# EasyEDA Pro project realtix-sakura_nfc-d968f2f9.epro, schematic Schematic2
Board Name: 鸟头杖; Create Date: 2025-03-24; Page Name: P1; Project Name: 小樱nfc鸟头杖; Schematic Name: Schematic2; Update Date: 2025-03-24; Company: 嘉立创EDA; Page Size: A3; Version: V1.0
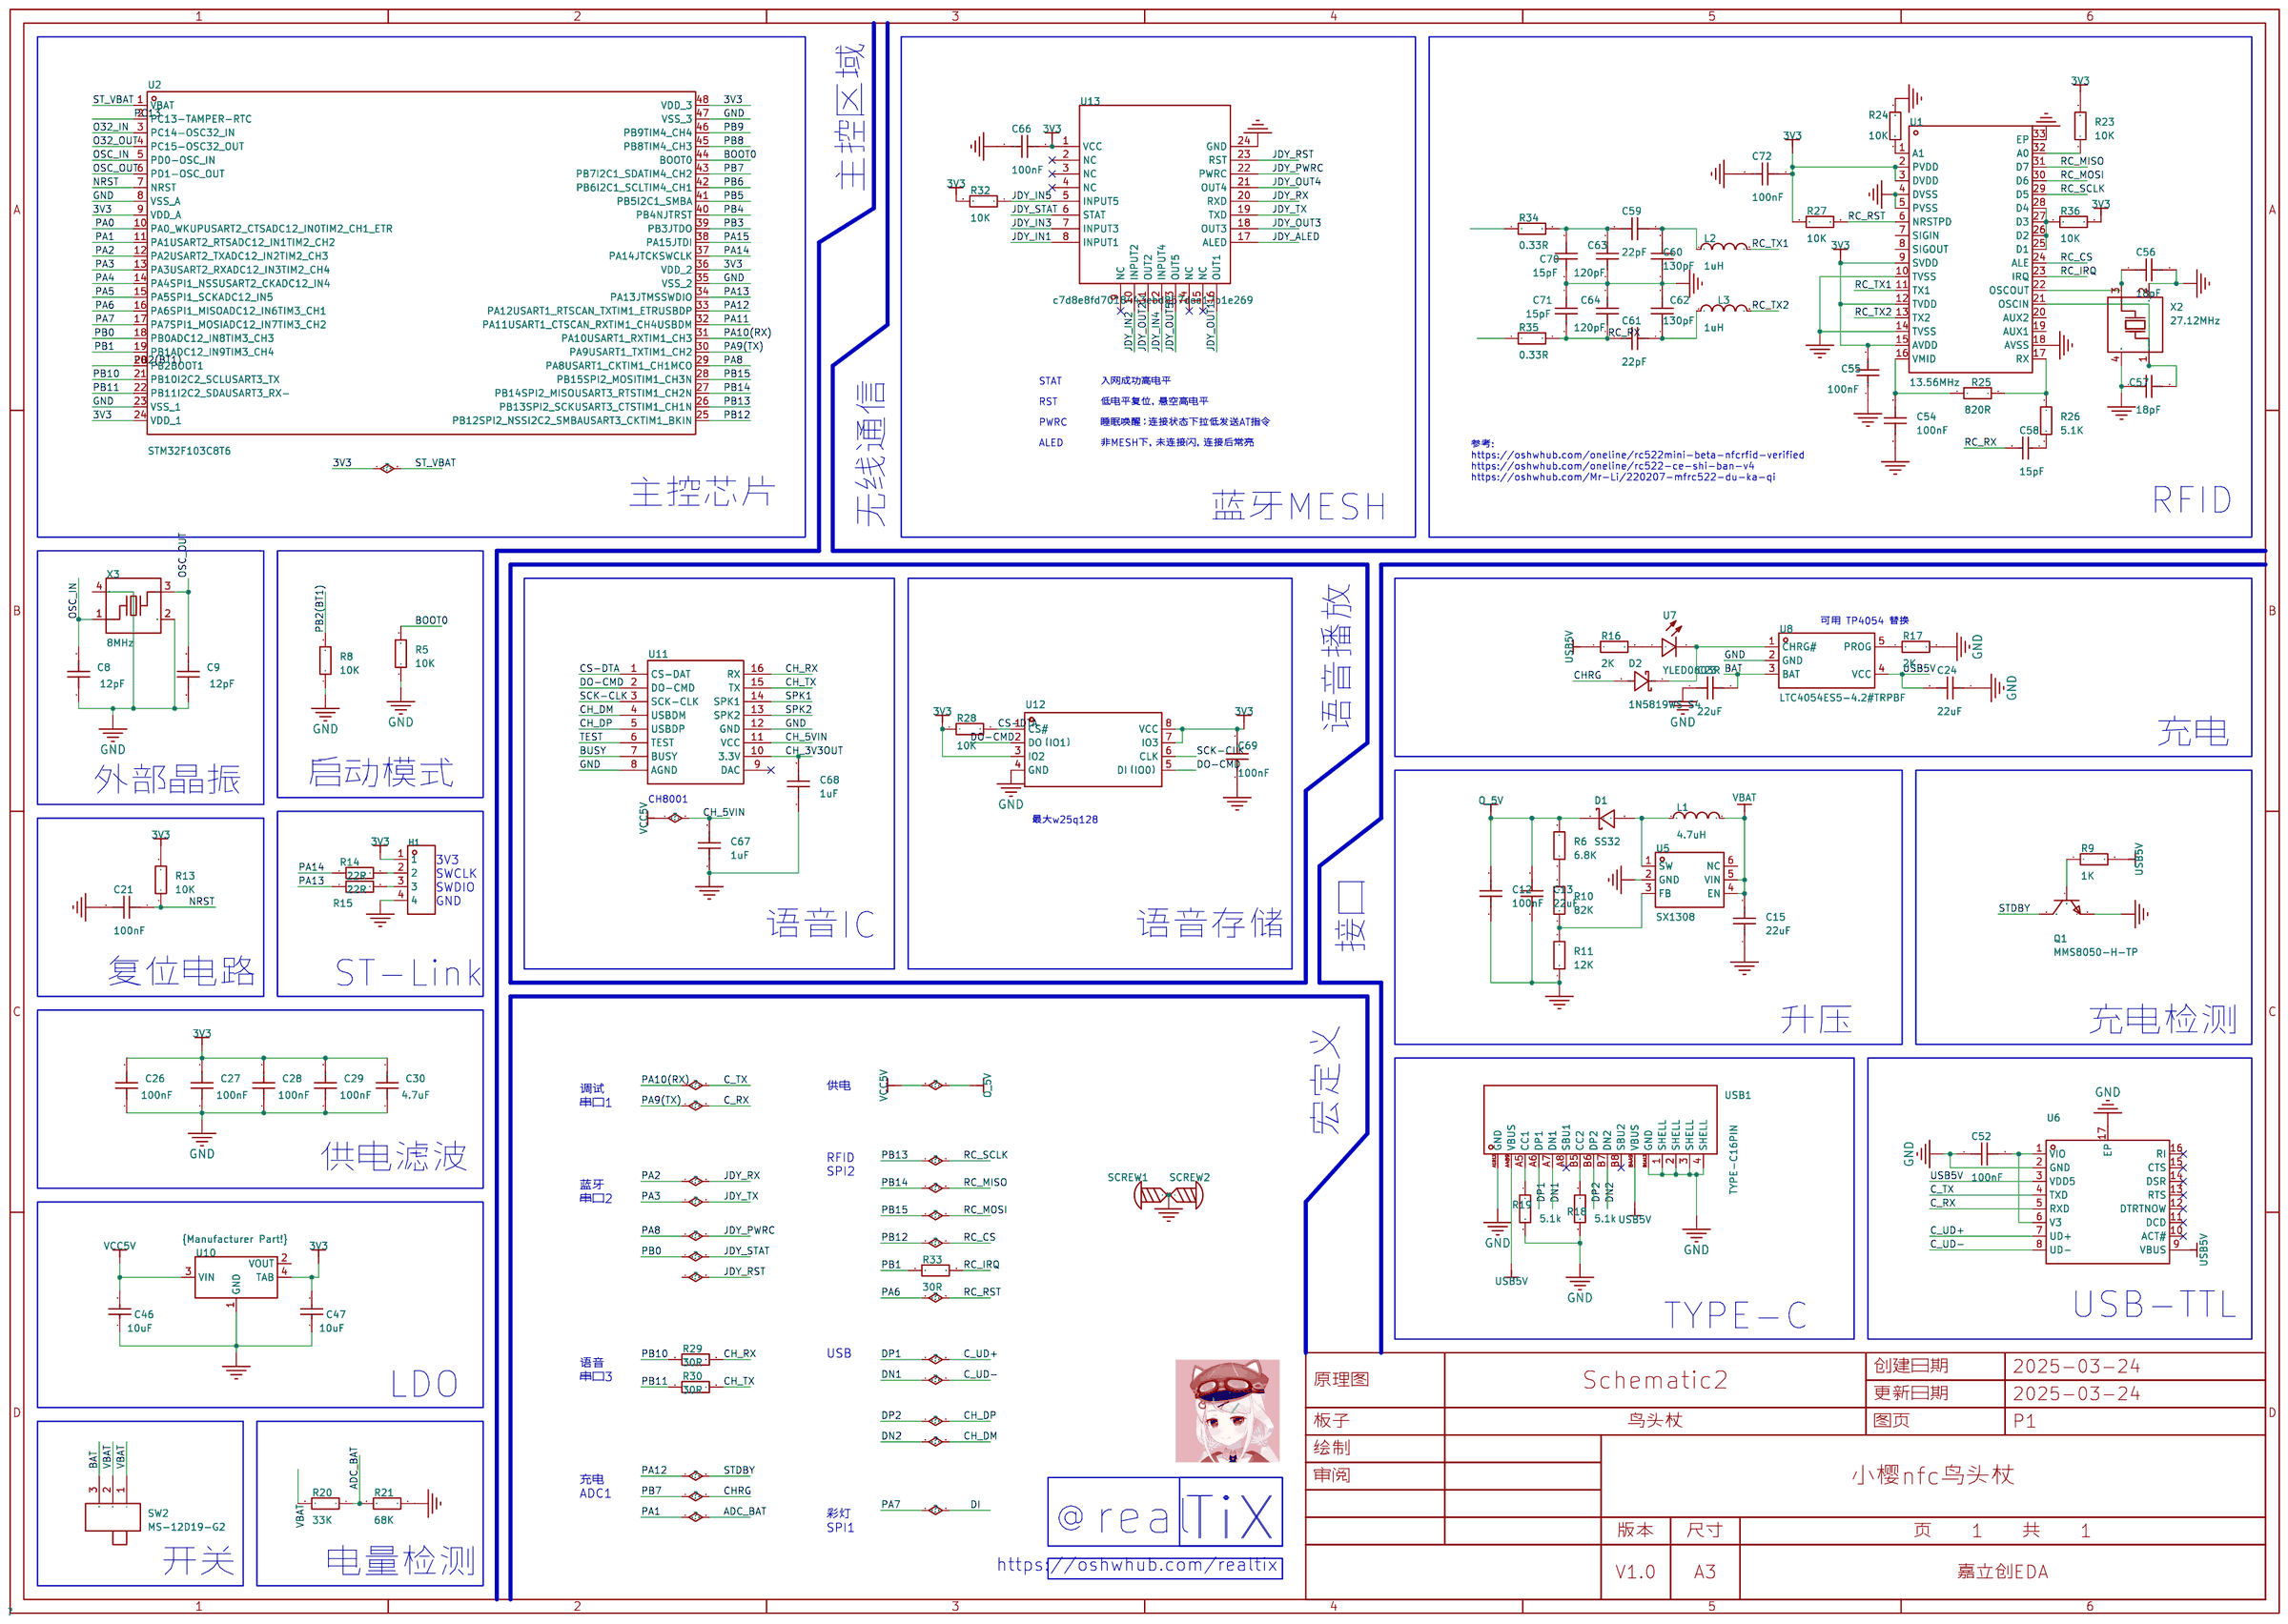
[diagram p1: schematic sheet]

## Parts
C8  12pF  [C0603]
C9  12pF  [C0603]
C12  100nF  [C0603]
C13  22uF  [C0805]
C15  22uF  [C0805]
C21  100nF  [C0603]
C23  22uF  [C0805]
C24  22uF  [C0805]
C26  100nF  [C0603]
C27  100nF  [C0603]
C28  100nF  [C0603]
C29  100nF  [C0603]
C30  4.7uF  [C0805]
C46  10uF  [C0805]
C47  10uF  [C0805]
C52  100nF  [C0603]
C54  100nF  [C0603]
C55  100nF  [C0603]
C56  18pF  [C0603]
C57  18pF  [C0603]
C58  15pF  [C0603]
C59  22pF  [C0603]
C60  130pF  [C0603]
C61  22pF  [C0603]
C62  130pF  [C0603]
C63  120pF  [C0603]
C64  120pF  [C0603]
C66  100nF  [C0603]
C67  1uF  [C0603]
C68  1uF  [C0603]
C69  100nF  [C0603]
C70  15pF  [C0603]
C71  15pF  [C0603]
C72  100nF  [C0603]
D1  SS32  [SMA_L4.4-W2.8-LS5.4-RD]
D2  1N5819WS S4  [SOD-323_L1.6-W1.3-LS2.7-RD]
H1  PZ254V-11-04P  [HDR-TH_4P-P2.54-V-M]
L1  4.7uH  [IND-SMD_L4.4-W4.2]
L2  1uH  [L0805]
L3  1uH  [L0805]
Q1  MMS8050-H-TP  [SOT-23-3_L2.9-W1.3-P1.90-LS2.4-BR]
R5  10K  [R0603]
R6  6.8K  [R0603]
R8  10K  [R0603]
R9  1K  [R0603]
R10  82K  [R0603]
R11  12K  [R0603]
R13  10K  [R0603]
R14  22R  [R0603]
R15  22R  [R0603]
R16  2K  [R0603]
R17  2K  [R0603]
R18  5.1k  [R0603]
R19  5.1k  [R0603]
R20  33K  [R0603]
R21  68K  [R0603]
R23  10K  [R0603]
R24  10K  [R0603]
R25  820R  [R0603]
R26  5.1K  [R0603]
R27  10K  [R0603]
R28  10K  [R0603]
R29  30R  [R0603]
R30  30R  [R0603]
R32  10K  [R0603]
R33  30R  [R0603]
R34  0.33R  [R0603]
R35  0.33R  [R0603]
R36  10K  [R0603]
SCREW1  -  [M2螺丝]
SCREW2  -  [M2螺丝]
SW2  MS-12D19-G2  [SW-TH_DEALON_MS-12D19-G2]
U1  13.56MHz  [QFN-32_L5.0-W5.0-P0.50-TL-EP3.1]
U2  STM32F103C8T6  [LQFP-48_L7.0-W7.0-P0.50-LS9.0-BL]
U5  SX1308  [SOT-23-6_L2.9-W1.6-P0.95-LS2.8-BL]
U6  CH343P  [TQFN-16_L3.0-W3.0-P0.50-BL-EP1.7]
U7  YLED0603R  [LED0603-FD]
U8  LTC4054ES5-4.2#TRPBF  [TSOT-23-5_L2.9-W1.6-P0.95-LS2.8-BL]
U10  -  [SOT_223]
U11  -  [SOP-16_L9.9-W3.9-P1.27-LS6.0-BL]
U12  W25Q32JVSSIQ  [SOIC-8_L5.3-W5.3-P1.27-LS8.0-BL]
U13  c7d8e8fd7018443ebd857dee17b1e269  [JDY-25M]
USB1  TYPE-C16PIN  [USB-C-SMD_TYPE-C16PIN]
X2  27.12MHz  [CRYSTAL-SMD_4P-L3.2-W2.5-BL-1]
X3  8MHz  [CRYSTAL-SMD_4P-L3.2-W2.5-BL]

## Library data of the parts
C8 C9 C12 C21 C26-C30 C52 C54-C57 C66-C69 C72 = CAP_0603: Supplier Footprint: 0603
C13 C15 = CL21A226MAQNNNE_C45783: 容值:22uF;精度:±20%;额定电压:25V;材质(温度系数):X5R;; LCSC Part Name: 22uF ±20% 25V; Supplier Part: C45783; Manufacturer: SAMSUNG(三星); Manufacturer Part: CL21A226MAQNNNE; Supplier Footprint: 0805; JLCPCB Part Class: Basic Part; Datasheet: https://atta.szlcsc.com/upload/public/pdf/source/20160103/1457707727161.pdf; Supplier: LCSC; Tolerance: ±20%; Voltage Rated: 25V; Temperature Coefficient: X5R
C23 C24 = C2012X5R1V226MT000E: 温度系数:X5R;额定电压:35V;电容体长:-;电容体宽:-;电容体厚度:-;精度:±20%;容值:22uF;; LCSC Part Name: 22uF(226) ±20% 35V; Supplier Part: C338080; Manufacturer: TDK; Supplier Footprint: 0805; JLCPCB Part Class: Extended Part; Datasheet: https://atta.szlcsc.com/upload/public/pdf/source/20181206/C338080_066671AD469AE9D3706F78911D2065BC.pdf; Supplier: LCSC; Temperature Coefficient: X5R; Voltage Rated: 35V; Tolerance: ±20%
C46 C47 = CL21A106KAYNNNE_C15850: 容值:10uF;精度:±10%;额定电压:25V;材质(温度系数):X5R;; LCSC Part Name: 10uF ±10% 25V; Supplier Part: C15850; Manufacturer: SAMSUNG(三星); Manufacturer Part: CL21A106KAYNNNE; Supplier Footprint: 0805; JLCPCB Part Class: Basic Part; Datasheet: https://atta.szlcsc.com/upload/public/pdf/source/20160103/1457707679302.pdf; Supplier: LCSC; Tolerance: ±10%; Voltage Rated: 25V; Temperature Coefficient: X5R
C58 = CC0603JRNPO9BN102: 容值:1nF;精度:±5%;额定电压:50V;材质(温度系数):NP0;; LCSC Part Name: 1nF ±5% 50V; Supplier Part: C106246; Manufacturer: YAGEO(国巨); Supplier Footprint: 0603; JLCPCB Part Class: 扩展库; Datasheet: https://atta.szlcsc.com/upload/public/pdf/source/20170505/1493957838062.pdf; Supplier: LCSC; Tolerance: ±5%; Voltage Rated: 50V; Temperature Coefficient: NP0
C59 C61 C70 C71 = CC0603JRNPO9BN620: 容值:62pF;精度:±5%;额定电压:50V;材质(温度系数):NP0;; LCSC Part Name: 62pF ±5% 50V; Supplier Part: C282073; Manufacturer: YAGEO(国巨); Supplier Footprint: 0603; JLCPCB Part Class: 扩展库; Datasheet: https://atta.szlcsc.com/upload/public/pdf/source/20181008/C309499_21CC21451B82C39E3D92150FD6B30293.pdf; Supplier: LCSC; Tolerance: ±5%; Voltage Rated: 50V; Temperature Coefficient: NP0
C60 C62-C64 = CC0603JRNPO9BN131: 容值:130pF;精度:±5%;额定电压:50V;材质(温度系数):NP0;; LCSC Part Name: 130pF ±5% 50V; Supplier Part: C519399; Manufacturer: YAGEO(国巨); Supplier Footprint: 0603; JLCPCB Part Class: 扩展库; Datasheet: https://atta.szlcsc.com/upload/public/pdf/source/20200423/C519399_EB8E76D9BE3CFA01619FE057CC4F9BFA.pdf; Supplier: LCSC; Tolerance: ±5%; Voltage Rated: 50V; Temperature Coefficient: NP0
D1 = SS32_C123938: 20V 3A VF=0.55V@3A; Supplier Part: C123938; Manufacturer: 晶导微电子; Supplier Footprint: SMA(DO-214AC); JLCPCB Part Class: Extended Part; Datasheet: https://atta.szlcsc.com/upload/public/pdf/source/20170804/C123938_1501836222047866178.pdf; Supplier: LCSC
D2 = 1N5819WS S4_C2927280: 二极管配置:独立式;直流反向耐压(Vr):40V;平均整流电流(Io):350mA;正向压降(Vf):600mV@200mA;反向电流(Ir):5uA@30V;; LCSC Part Name: 40V 350mA 600mV@200mA; Supplier Part: C2927280; Manufacturer: JSMSEMI(杰盛微); Supplier Footprint: SOD-323; JLCPCB Part Class: 扩展库; Datasheet: https://atta.szlcsc.com/upload/public/pdf/source/20211230/020DF3ABCB41CBA5E28580D63AFB2CA3.pdf; Supplier: LCSC; Diode Configuration: 独立式; Reverse Voltage (Vr): 40V; Average Rectified Current (Io): 350mA; Forward Voltage (Vf@If): 600mV@200mA; Reverse Leakage Current (Ir): 5uA@30V
H1 = PZ254V-11-04P: 排数:单排;总PIN位数:4P;间距:2.54mm;插针结构:1x4P;行距:-;安装类型:直插;圆针/方针:方针;额定电流:3A;额定电压:250V;配合针长度:6mm;塑高:2.5mm;端接针长度:3mm;触头材质:-;工作温度范围:-40℃~+105℃;颜色:黑色;; LCSC Part Name: 2.54mm 1x4P 直插 方针; Supplier Part: C2691448; Manufacturer: XFCN(兴飞); Supplier Footprint: 插件,P=2.54mm; JLCPCB Part Class: 扩展库; Datasheet: https://atta.szlcsc.com/upload/public/pdf/source/20200309/C492403_F9F19131791D08044AD4F84F8E751A34.pdf; Supplier: LCSC; Number of Rows: 单排; Number of Pins: 4P; Pitch: 2.54mm; Pin Structure: 1x4P; Mounting Type: 直插; Circluar Pins/Square Pins: 方针; Current Rating (Max): 3A; Voltage Rating (Max): 250V; Length of Mating Pin: 6mm; Insulation Height: 2.5mm; Length of End Connection Pin: 3mm; Operating Temperature Range: -40℃~+105℃; Color: 黑色
L1 = FXL0420-4R7-M: 电感值:4.7uH;精度:±20%;额定电流:2.8A;饱和电流(Isat):3A;类型:一体成型电感;; LCSC Part Name: 4.7uH ±20% 3A; Supplier Part: C167208; Manufacturer: cjiang(长江微电); Supplier Footprint: SMD,4.2x4.4mm; JLCPCB Part Class: 扩展库; Datasheet: https://atta.szlcsc.com/upload/public/pdf/source/20240426/3189EA8206330E2108542F9E34E540E7.pdf; Supplier: LCSC; Tolerance: ±20%; Rated Current: 2.8A; Saturation Current (Isat): 3A; DC Resistance (DCR): 105mΩ; Type: 一体成型电感
L2 L3 = SDFL2012Q1R0KTF: 电感值:1uH;精度:±10%;额定电流:50mA;饱和电流(Isat):-;直流电阻(DCR):400mΩ;; LCSC Part Name: 1uH ±10%; Supplier Part: C1042; Manufacturer: Sunlord(顺络); Supplier Footprint: 0805; JLCPCB Part Class: 扩展库; Datasheet: https://atta.szlcsc.com/upload/public/pdf/source/20231027/097A17DDB71564CE812E62F0F80142C9.pdf; Supplier: LCSC; Tolerance: ±10%; Rated Current: 50mA; DC Resistance(DCR): 400mΩ
Q1 = MMS8050-H-TP: 晶体管类型:NPN;集电极电流(Ic):500mA;集射极击穿电压(Vceo):25V;功率(Pd):300mW;直流电流增益(hFE@Ic,Vce):120@50mA,1V;; LCSC Part Name: 耐压:25V 电流:500mA NPN; Supplier Part: C668971; Manufacturer: MCC(美微科); Supplier Footprint: SOT-23; JLCPCB Part Class: 扩展库; Datasheet: https://atta.szlcsc.com/upload/public/pdf/source/20200618/C668971_E8C4278A0C61D2294D468F2197C24659.pdf; Supplier: LCSC; Transistor Type: NPN; Collector Current (Ic): 500mA; Collector-Emitter Breakdown Voltage (Vceo): 25V; Power Dissipation (Pd): 300mW; DC Current Gain (hFE@Ic,Vce): 120@50mA,1V; Transition Frequency (fT): 150MHz; Collector Cut-Off Current (Icbo): 100nA; Collector-Emitter Saturation Voltage (VCE(sat)@Ic,Ib): 600mV@500mA,50mA; Operating Temperature: -55℃~+150℃@(Tj)
R5 R6 R8-R11 R13-R21 R23-R30 R32-R36 = Res_0603: Supplier Footprint: 0603
SCREW1 SCREW2 = M2螺丝: Supplier Footprint: 插件
SW2 = MS-12D19-G2: 电路结构:单刀双掷;安装方式:直插;开关颜色:黑色;机械寿命:-;; LCSC Part Name: 微型拨动开关; Supplier Part: C2904913; Manufacturer: DEALON(德艺隆); Supplier Footprint: 插件; JLCPCB Part Class: 扩展库; Datasheet: https://atta.szlcsc.com/upload/public/pdf/source/20211116/C3654A9EE70C7943DC8E86D3F9EB182A.pdf; Supplier: LCSC; Circuit: 单刀双掷; Actuator Style: 矩形柱状; Pin Style: PC引脚; Switch Length: 9mm; Switch Width: 3.5mm; Switch Height: 5.5mm; Mounting Style: 直插; Actuator Color: 黑色
U1 = MFRC522: 协议:ISO 14443A；ISO 14443B;接口类型:I2C；UART；SPI;传输速率:9.6Kbps;; LCSC Part Name: 标准3V MIFARE读卡器解决方案; Supplier Part: C2760772; Manufacturer: JSMSEMI(杰盛微); Supplier Footprint: QFN-32-EP(5x5); JLCPCB Part Class: 扩展库; Datasheet: https://atta.szlcsc.com/upload/public/pdf/source/20240328/DAD0AAAC32ED29173B34D9DCB65EF43F.pdf; Supplier: LCSC; agreement: ISO 14443A；ISO 14443B; interface type: I2C；UART；SPI; transmission rate: 9.6Kbps; mains input: 2.5V~4V
U2 = STM32F103CBT6: CPU内核:ARM Cortex-M3;CPU最大主频:72MHz;工作电压范围:2V~3.6V;内部振荡器:有;程序 FLASH容量:128K@x8bit;RAM总容量:20KB;EEPROM/数据 FLASH容量:-;GPIO端口数量:37;ADC(单元数/通道数/位数):1@x10ch/12bit;外设/功能/协议栈:DMA；看门狗；片载温度传感器；PWM;工作温度范围:-40℃~+85℃;; LCSC Part Name: ARMCortex-M372MHz闪存：128K@x8bitRAM：20KB; Supplier Part: C8304; Manufacturer: ST(意法半导体); Supplier Footprint: LQFP-48(7x7); JLCPCB Part Class: ExtendedPart; Datasheet: https://atta.szlcsc.com/upload/public/pdf/source/20140724/1457707170379.pdf; Supplier: LCSC; CPU Core: ARMCortex-M3; Maximum Frequency: 72MHz; Supply Voltage Range: 2V~3.6V; Internal Oscillator: 有; Program FLASH Size: 128K@x8bit; RAM Size: 20KB; GPIO Ports Number: 37; ADC (Units/Channels/bits): 1@x10ch/12bit; Peripherals / Functions / Protocol Stacks: DMA；看门狗；片载温度传感器；PWM; Operating Temperature Range: -40℃~+85℃
U5 = SX1308: 功能类型:升压型;同步整流:否;输出通道数:1;拓扑结构:升压式;输入电压:2V~24V;输出电压:28V;输出电流(最大值):-;开关频率:1.2MHz;; LCSC Part Name: 升压型 Vin=2V~24V Vout=28V; Supplier Part: C78162; Manufacturer: SX(硕芯科技); Supplier Footprint: SOT-23-6; JLCPCB Part Class: Extended Part; Datasheet: https://atta.szlcsc.com/upload/public/pdf/source/20160920/1474356679185.pdf; Supplier: LCSC; Function: 升压型; Synchronous Rectification: 否; Number of Outputs: 1; Topology: 升压式; Input Voltage: 2V~24V; Output Voltage: 28V; Switching Frequency: 1.2MHz
U6 = CH343P: 类型:-;协议类别:-;驱动器/接收器数:-;数据速率:-;; Supplier Part: C2846043; Manufacturer: WCH(南京沁恒); Supplier Footprint: QFN-16; JLCPCB Part Class: Extended Part; Datasheet: https://atta.szlcsc.com/upload/public/pdf/source/20211010/C2846043_7FA705E1F14A2906F6A2AFA45FA28209.pdf; Supplier: LCSC
U7 = YLED0603R: 发光颜色:红色;正向电压(VF):1.8V~2.4V;功率:-;正向电流:25mA;主波长:620nm~625nm;二极管配置:-;透镜颜色:-;色温:-;发光强度:-;发光角度:-;载带方式:-;工作温度:-40℃~+85℃;; Supplier Part: C19171390; Manufacturer: YONGYUTAI(永裕泰); Supplier Footprint: 0603; JLCPCB Part Class: 扩展库; Datasheet: https://atta.szlcsc.com/upload/public/pdf/source/20231027/FB19AF06E2C70028E58AB5CEDD1BDC72.pdf; Supplier: LCSC; Emitted Color: 红色; Forward Voltage (VF): 1.8V~2.4V; Forward Current: 25mA; Dominant Wavelength: 620nm~625nm; Operating Temperature: -40℃~+85℃
U8 = LTC4054ES5-4.2#TRPBF: Supplier Part: C462648; Manufacturer: ADI(亚德诺)/LINEAR(凌特); Supplier Footprint: TSOT-23-5; JLCPCB Part Class: Extended Part; Datasheet: https://atta.szlcsc.com/upload/public/pdf/source/20170712/C117064_1499832277334814248.pdf; Supplier: LCSC
U10 = AMS1117
U11 = CH8001: 语音芯片16脚
U12 = W25Q32JVSSIQ_C82344: 存储器类型:Non-Volatile;存储器构架(格式):FLASH;存储器容量:32Mb (4M x 8);存储器接口类型:SPI - Dual/Quad I/O;; Supplier Part: C82344; Manufacturer: WINBOND(华邦); Supplier Footprint: SOIC-8_208mil; JLCPCB Part Class: 扩展库; Datasheet: https://atta.szlcsc.com/upload/public/pdf/source/20160910/1473490310454.pdf; Supplier: LCSC; Memory Type: Non-Volatile; Memory Format: FLASH; Memory Size: 32Mb (4M x 8); Memory Interface: SPI - Dual/Quad I/O; Voltage - Supply: 2.7V ~ 3.6V
U13 = JDY-25M: 蓝牙mesh组网模组
USB1 = TYPE-C16PIN: 连接器类型:Type-C;标准:-;公母:母座;触点数量:16;端口数量:1;安装方式:卧贴;额定电流 - 电源:3A;工作温度范围:-40℃~+85℃;; LCSC Part Name: Type-C 母座 卧贴 快充闪充 停产; Supplier Part: C393939; Manufacturer: SHOU HAN(首韩); Supplier Footprint: SMD; JLCPCB Part Class: Extended Part; Datasheet: https://atta.szlcsc.com/upload/public/pdf/source/20190521/C393939_7B9043D4CF1026AF443AB60D91FBCD5C.pdf; Supplier: LCSC; Connector Type: Type-C; Gender: 母座; Number of Contacts: 16; Number of Ports: 1; Mounting Style: 卧贴; Current Rating - Power (Max): 3A; Operating Temperature Range: -40℃~+85℃
X2 = X32252712MMB4SI: 晶振类型:贴片晶振;频率:27.12MHz;常温频差:±10ppm;负载电容:10pF;频率稳定度:±20ppm;; LCSC Part Name: 27.12MHz ±10ppm 10pF; Supplier Part: C29975; Manufacturer: YXC(扬兴晶振); Supplier Footprint: SMD3225-4P; JLCPCB Part Class: 扩展库; Datasheet: https://atta.szlcsc.com/upload/public/pdf/source/20240329/19D5F850207469550BEB00D7DFEDBC7A.pdf; Supplier: LCSC; Crystal Type: 贴片晶振; Normal temperature Frequency Tolerance: ±10ppm; Load Capacitance: 10pF; Frequency Stability: ±20ppm; Operating Temperature: -40℃~+85℃
X3 = X32258MOB4SI: 晶振类型:贴片晶振;频率:8MHz;常温频差:±10ppm;负载电容:12pF;频率稳定度:±20ppm;; LCSC Part Name: 8MHz ±10ppm 12pF; Supplier Part: C2682775; Manufacturer: YXC(扬兴晶振); Supplier Footprint: SMD3225-4P; JLCPCB Part Class: 扩展库; Datasheet: https://atta.szlcsc.com/upload/public/pdf/source/20240329/19D5F850207469550BEB00D7DFEDBC7A.pdf; Supplier: LCSC; Type: 贴片晶振; Normal temperature Frequency Tolerance: ±10ppm; Load Capacitance: 12pF; Frequency Stability: ±20ppm; Equivalent Series Resistance(ESR): 150Ω; Operating Temperature: -40℃~+85℃

## Nets
3V3: C26.2 C27.2 C28.2 C29.2 C30.2 C47.2 C55.2 C66.2 C69.2 C72.1 H1.1 R13.2 R23.2 R27.1 R28.1 R32.2 R36.2 U1.2(PVDD) U1.3(DVDD) U1.9(SVDD) U1.12(TVDD) U1.15(AVDD) U2.1(VBAT) U2.9(VDD_A) U2.24(VDD_1) U2.36(VDD_2) U2.48(VDD_3) U10.4(TAB) U12.3(IO2) U12.7(IO3) U12.8(VCC) U13.1(VCC)
GND: C8.1 C9.1 C12.1 C13.1 C15.1 C21.2 C23.1 C24.1 C26.1 C27.1 C28.1 C29.1 C30.1 C46.1 C47.1 C52.1 C54.1 C55.1 C56.2 C57.1 C60.1 C62.2 C63.1 C64.2 C66.1 C67.1 C68.1 C69.1 C70.2 C71.1 C72.2 H1.4 Q1.2(E) R5.1 R8.1 R11.1 R17.2 R18.2 R19.2 R21.1 R24.2 SCREW1.1 SCREW2.1 U1.4(DVSS) U1.5(PVSS) U1.10(TVSS) U1.14(TVSS) U1.18(AVSS) U1.33(EP) U2.8(VSS_A) U2.23(VSS_1) U2.35(VSS_2) U2.47(VSS_3) U5.2(GND) U6.2(GND) U6.17(EP) U8.2(GND) U10.1(GND) U11.8(AGND) U11.12(GND) U12.4(GND) U13.24(GND) USB1.1(SHELL) USB1.2(SHELL) USB1.3(SHELL) USB1.4(SHELL) USB1.A1B12(GND) USB1.B1A12(GND) X2.2(GND) X2.4(GND) X3.2(GND) X3.4(GND)
VBAT: C15.2 L1.2 R20.2 SW2.1 SW2.2 U5.4(EN) U5.5(VIN)
ADC_BAT: R20.1 R21.2 U2.11(PA1USART2_RTSADC12_IN1TIM2_CH2)
BAT: C23.2 SW2.3 U8.3(BAT)
BOOT0: R5.2 U2.44(BOOT0)
BUSY: U11.7(BUSY)
C_RX: U2.30(PA9USART1_TXTIM1_CH2) U6.5(RXD)
C_TX: U2.31(PA10USART1_RXTIM1_CH3) U6.4(TXD)
C_UD+: U6.7(UD+) USB1.A6(DP1)
C_UD-: U6.8(UD-) USB1.A7(DN1)
CH_3V3OUT: C68.2 U11.10(3.3V)
CH_DM: U11.4(USBDM) USB1.B7(DN2)
CH_DP: U11.5(USBDP) USB1.B6(DP2)
CH_RX: R29.2 U11.16(RX)
CH_TX: R30.2 U11.15(TX)
CHRG: D2.2(A) U2.43(PB7I2C1_SDATIM4_CH2)
CS-DTA: R28.2 U11.1(CS-DAT) U12.1(CS#)
DI: U2.17(PA7SPI1_MOSIADC12_IN7TIM3_CH2)
DO-CMD: U11.2(DO-CMD) U12.2(DO（IO1）) U12.5(DI（IO0）)
JDY_ALED: U13.17(ALED)
JDY_IN1: U13.8(INPUT1)
JDY_IN2: U13.10(INPUT2)
JDY_IN3: U13.7(INPUT3)
JDY_IN4: U13.12(INPUT4)
JDY_IN5: R32.1 U13.5(INPUT5)
JDY_OUT1: U13.16(OUT1)
JDY_OUT2: U13.11(OUT2)
JDY_OUT3: U13.18(OUT3)
JDY_OUT4: U13.21(OUT4)
JDY_OUT5: U13.13(OUT5)
JDY_PWRC: U2.29(PA8USART1_CKTIM1_CH1MCO) U13.22(PWRC)
JDY_RST: U13.23(RST)
JDY_RX: U2.12(PA2USART2_TXADC12_IN2TIM2_CH3) U13.20(RXD)
JDY_STAT: U2.18(PB0ADC12_IN8TIM3_CH3) U13.6(STAT)
JDY_TX: U2.13(PA3USART2_RXADC12_IN3TIM2_CH4) U13.19(TXD)
NRST: C21.1 R13.1 U2.7(NRST)
O32_IN: U2.3(PC14-OSC32_IN)
O32_OUT: U2.4(PC15-OSC32_OUT)
O_5V: C12.2 C13.2 C46.2 C67.2 D1.1(K) R6.2 U10.3(VIN) U11.11(VCC)
OSC_IN: C8.2 U2.5(PD0-OSC_IN) X3.1
OSC_OUT: C9.2 U2.6(PD1-OSC_OUT) X3.3
PA0: U2.10(PA0_WKUPUSART2_CTSADC12_IN0TIM2_CH1_ETR)
PA4: U2.14(PA4SPI1_NSSUSART2_CKADC12_IN4)
PA5: U2.15(PA5SPI1_SCKADC12_IN5)
PA6: R27.2 U1.6(NRSTPD) U2.16(PA6SPI1_MISOADC12_IN6TIM3_CH1)
PA11: U2.32(PA11USART1_CTSCAN_RXTIM1_CH4USBDM)
PA12: Q1.3(C) U2.33(PA12USART1_RTSCAN_TXTIM1_ETRUSBDP)
PA13: R15.1 U2.34(PA13JTMSSWDIO)
PA14: R14.1 U2.37(PA14JTCKSWCLK)
PA15: U2.38(PA15JTDI)
PB1: R33.1 U2.19(PB1ADC12_IN9TIM3_CH4)
PB2(BT1): R8.2 U2.20(PB2BOOT1)
PB3: U2.39(PB3JTDO)
PB4: U2.40(PB4NJTRST)
PB5: U2.41(PB5I2C1_SMBA)
PB6: U2.42(PB6I2C1_SCLTIM4_CH1)
PB8: U2.45(PB8TIM4_CH3)
PB9: U2.46(PB9TIM4_CH4)
PB10: R29.1 U2.21(PB10I2C2_SCLUSART3_TX)
PB11: R30.1 U2.22(PB11I2C2_SDAUSART3_RX-)
PB12: U1.24(ALE) U2.25(PB12SPI2_NSSI2C2_SMBAUSART3_CKTIM1_BKIN)
PB13: U1.29(D5) U2.26(PB13SPI2_SCKUSART3_CTSTIM1_CH1N)
PB14: U1.31(D7) U2.27(PB14SPI2_MISOUSART3_RTSTIM1_CH2N)
PB15: U1.30(D6) U2.28(PB15SPI2_MOSITIM1_CH3N)
PC13: U2.2(PC13-TAMPER-RTC)
RC_IRQ: R33.2 U1.23(IRQ)
RC_RX: C58.2 C61.2 C64.1 C71.2 R35.2
RC_TX1: L2.2 U1.11(TX1)
RC_TX2: L3.2 U1.13(TX2)
SCK-CLK: U11.3(SCK-CLK) U12.6(CLK)
SPK1: U11.14(SPK1)
SPK2: U11.13(SPK2)
TEST: U11.6(TEST)
USB5V: C24.2 R9.2 R16.1 U6.3(VDD5) U6.9(VBUS) U8.4(VCC) USB1.A4B9(VBUS) USB1.B4A9(VBUS)
$1N2154: H1.3 R15.2
$1N2155: H1.2 R14.2
$1N3217: R18.1 USB1.B5(CC2)
$1N3218: R19.1 USB1.A5(CC1)
$1N3223: D1.2(A) L1.1 U5.1(SW)
$1N3227: R10.1 R11.2 U5.3(FB)
$1N3231: D2.1(C) U7.2(-) U8.1(CHRG#)
$1N3232: R17.1 U8.5(PROG)
$1N3240: R6.1 R10.2
$1N3241: R16.2 U7.1(+)
$1N3246: Q1.1(B) R9.1
$1N3263: C52.2 U6.1(VIO) U6.6(V3)
$1N3683: R24.1 U1.1(A1)
$1N3742: R23.1 U1.32(A0)
$1N3828: R25.2 R26.1 U1.17(RX)
$1N3888: C54.2 R25.1 U1.16(VMID)
$1N4680: C57.2 U1.21(OSCIN) X2.1(OSC1)
$1N4685: C56.1 U1.22(OSCOUT) X2.3(OSC2)
$1N5396: C59.1 C60.2 L2.1
$1N5401: C61.1 C62.1 L3.1
$1N5405: C59.2 C63.2 C70.1 R34.2
$1N19556: C58.1 R26.2
$1N19599: R36.1 U1.25(D1) U1.26(D2) U1.27(D3) U1.28(D4)

Not connected (* = marked no-connect by the designer): R34 1; R35 1; U1 7(SIGIN) 8(SIGOUT) 19(AUX1) 20(AUX2); U5 6(NC); U6 10(ACT#)* 11(DCD)* 12(DTRTNOW)* 13(RTS)* 14(DSR)* 15(CTS)* 16(RI)*; U10 2(VOUT); U11 9(DAC)*; U13 2(NC)* 3(NC)* 4(NC)* 9(NC)* 14(NC)* 15(NC)*; USB1 A8(SBU1)* B8(SBU2)*

## Notes on the sheet
- 主控区域
- STAT
- 入网成功高电平
- RST
- 低电平复位，悬空高电平
- PWRC
- 睡眠唤醒；连接状态下拉低发送AT指令
- ALED
- 非MESH下，未连接闪，连接后常亮
- 参考:
  https://oshwhub.com/oneline/rc522mini-beta-nfcrfid-verified
  https://oshwhub.com/oneline/rc522-ce-shi-ban-v4
  https://oshwhub.com/Mr-Li/220207-mfrc522-du-ka-qi
- 主控芯片
- RFID
- 无线通信
- 蓝牙MESH
- 可用 TP4054 替换
- 语音播放
- 充电
- 启动模式
- 外部晶振
- CH8001
- 最大w25q128
- 3V3
- SWCLK
- GND
- SWDIO
- 语音IC
- 语音存储
- 接口
- 复位电路
- ST-Link
- 宏定义
- 升压
- 充电检测
- 调试
  串口1
- 供电
- RFID
  SPI2
- 供电滤波
- 蓝牙
  串口2
- USB-TTL
- TYPE-C
- 语音
  串口3
- USB
- LDO
- 充电
  ADC1
- 彩灯
  SPI1
- @
- real
- TiX
- TiX
- https://oshwhub.com/realtix
- 开关
- 电量检测
